# EasyEDA Pro project ProPrj_SensUs2026_ParisBioTek_PCBs.epro, schematic Schematic1_2
Board Name: Sensor board_2s_lp; Create Date: 2026-01-09; Page Name: P1; Project Name: PBT_PCB; Schematic Name: Schematic1_2; Update Date: 2026-08-30; Company: EasyEDA.com; Page Size: A4; Version: V1.0
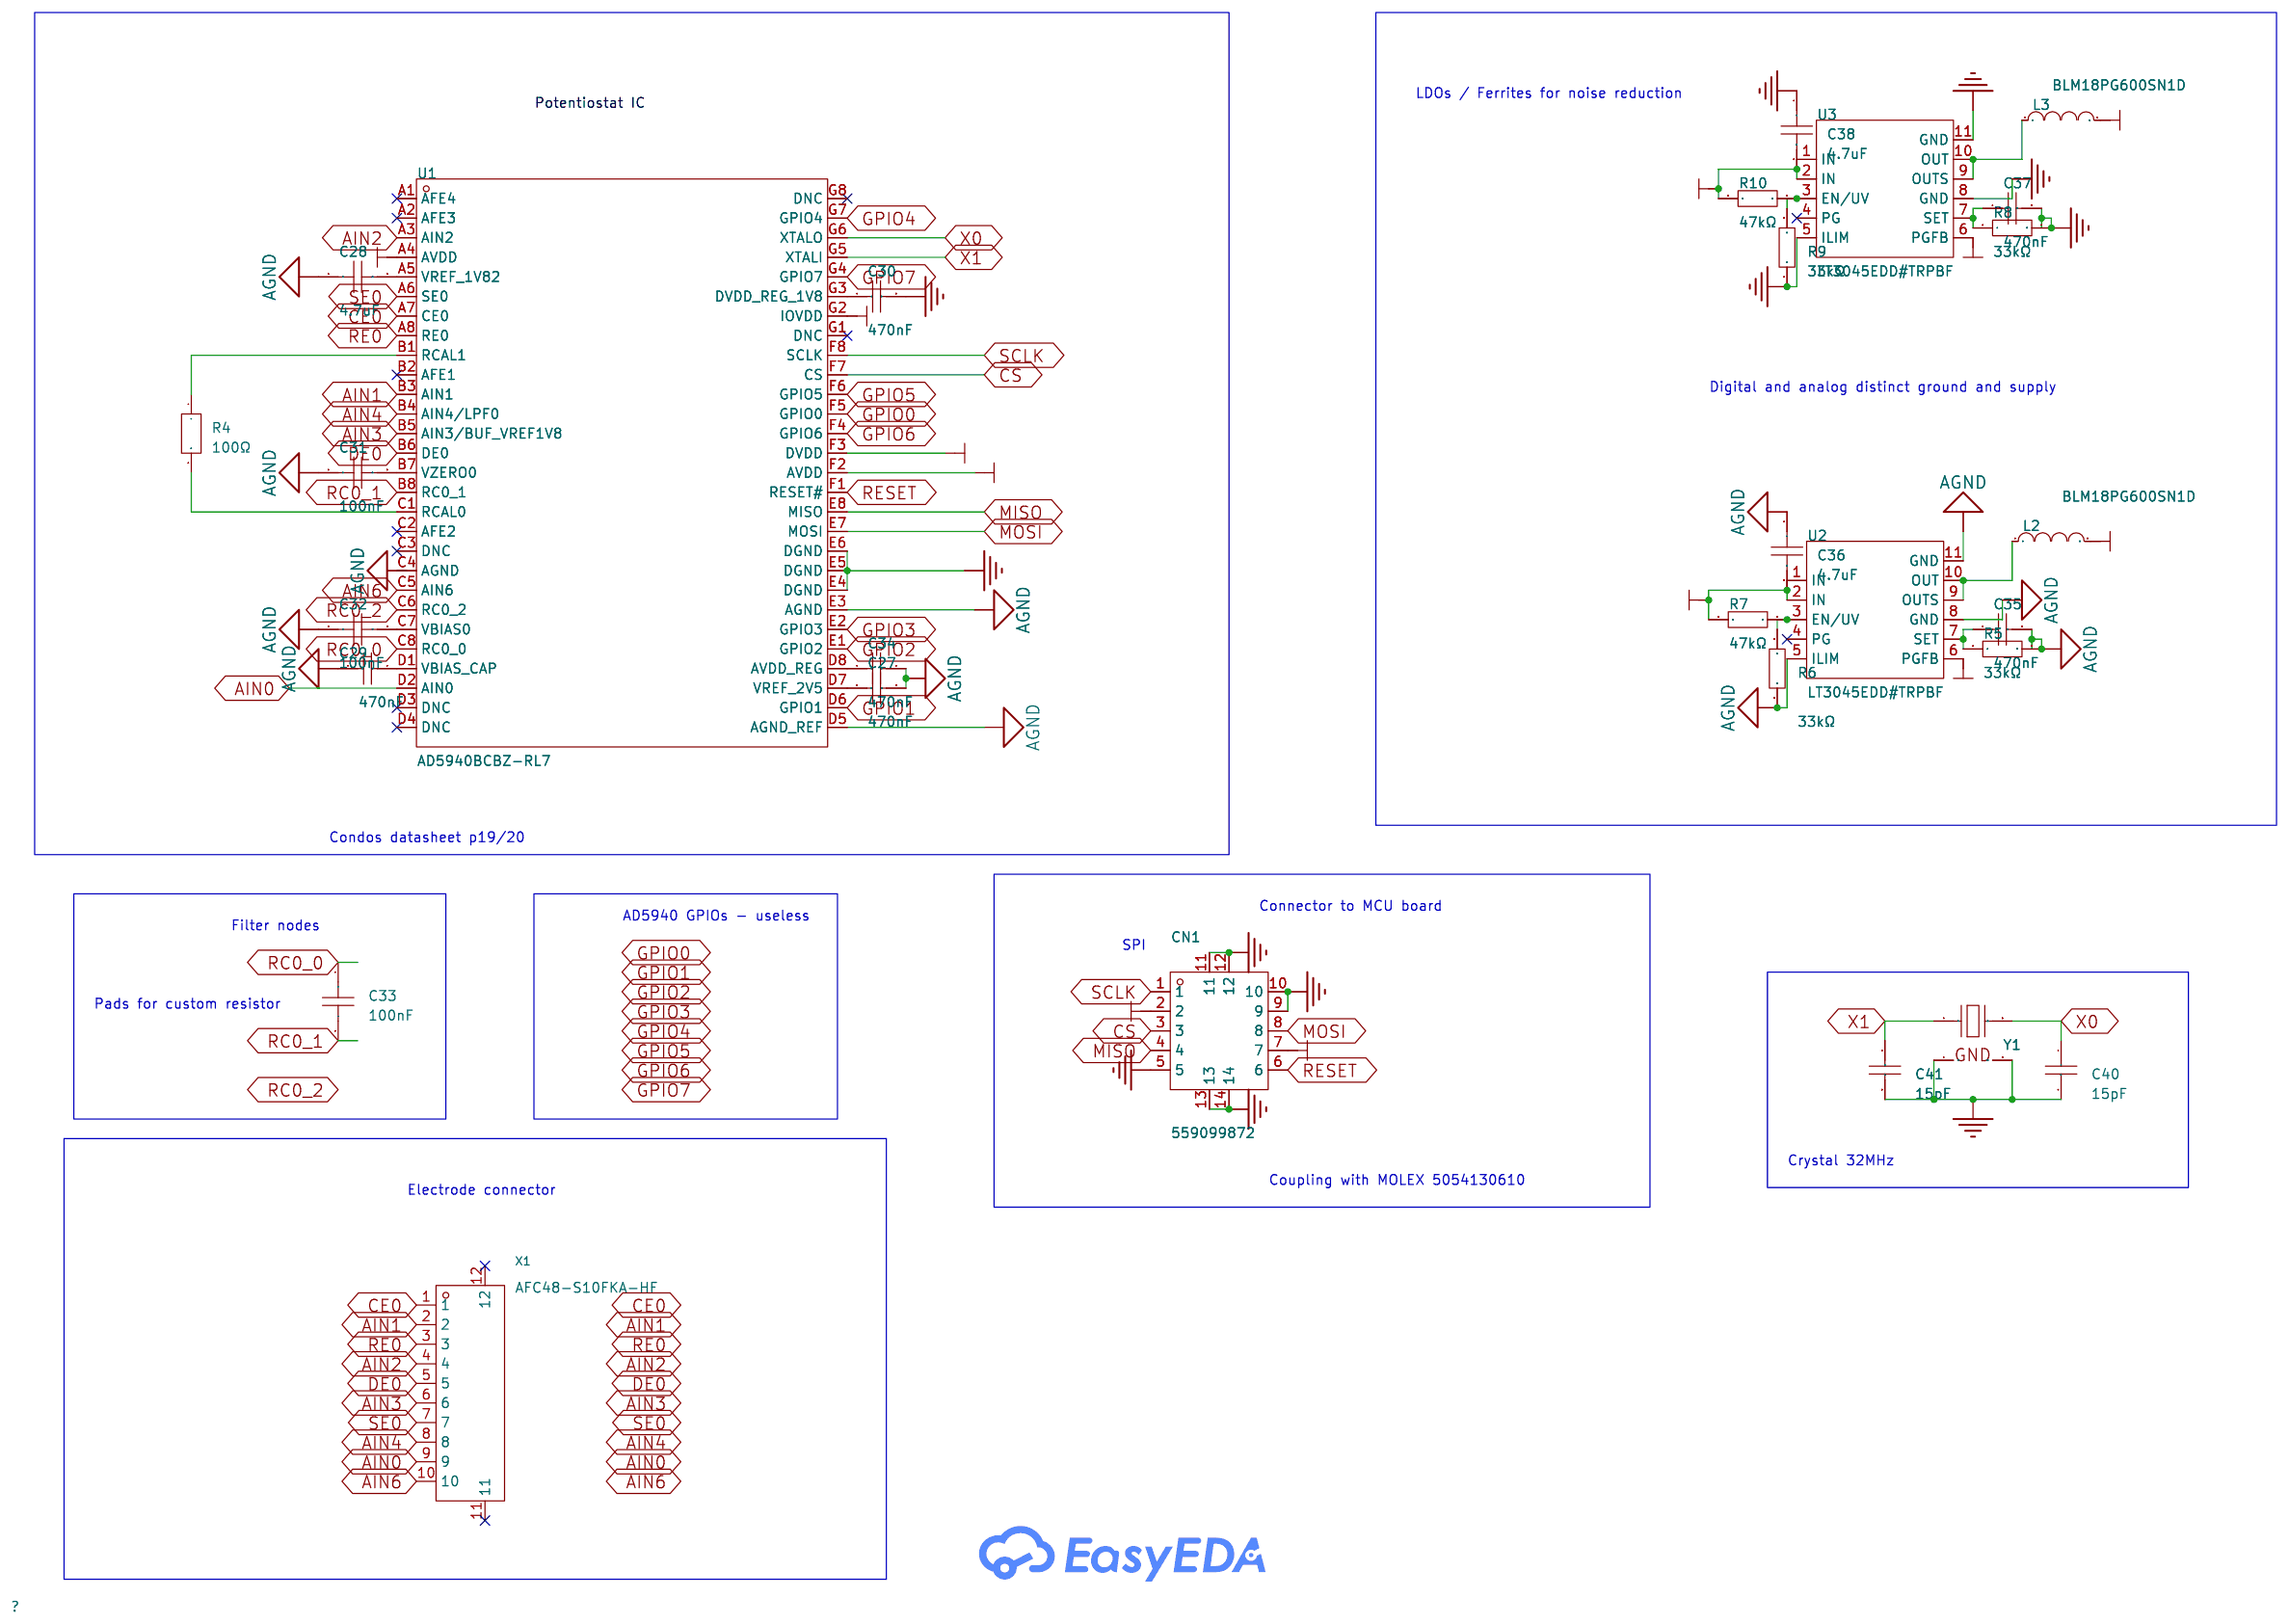
[diagram p0: schematic sheet]

## Parts
C27  470nF  [C0603]
C28  4.7uF  [C0402]
C29  470nF  [C0603]
C30  470nF  [C0603]
C31  100nF  [C0402]
C32  100nF  [C0402]
C33  100nF  [C0402]
C34  470nF  [C0603]
C35  470nF  [C0603]
C36  4.7uF  [C0402]
C37  470nF  [C0603]
C38  4.7uF  [C0402]
C40  15pF  [C0402]
C41  15pF  [C0402]
CN1  559099872  [CONN-SMD_559099872]
L2  BLM18PG600SN1D  [L0603]
L3  BLM18PG600SN1D  [L0603]
R4  100Ω  [R0603]
R5  33kΩ  [R0402]
R6  33kΩ  [R0402]
R7  47kΩ  [R0402]
R8  33kΩ  [R0402]
R9  33kΩ  [R0402]
R10  47kΩ  [R0402]
U1  AD5940BCBZ-RL7  [BGA-56_L4.2-W3.6-R8-C7-P0.40-TL]
U2  LT3045EDD#TRPBF  [DFN-10_L3.0-W3.0-P0.50-BL-EP]
U3  LT3045EDD#TRPBF  [DFN-10_L3.0-W3.0-P0.50-BL-EP]
X1  AFC48-S10FKA-HF  [FPC-SMD_AFC48-S10FKA-HF]
Y1  32MHz  [CRYSTAL-SMD_4P-L2.0-W1.6-BL]

## Library data of the parts
C27 C29 C30 C34 C35 C37 = CL10B474KA8NNNC: Capacitance:470nF Tolerance:±10% Tolerance:±10% Voltage Rating:25V Temperature Coefficient:X7R; LCSC Part Name: 470nF ±10% 25V; Supplier Part: C1623; Manufacturer: SAMSUNG(三星); Supplier Footprint: 0603; JLCPCB Part Class: Basic Part; Datasheet: https://item.szlcsc.com/datasheet/CL10B474KA8NNNC/1975.html; Supplier: LCSC; Tolerance: ±10%; Voltage Rating: 25V; Temperature Coefficient: X7R
C28 C36 C38 = CL05A475MP5NRNC: Capacitance:4.7uF Tolerance:±20% Tolerance:±20% Voltage Rating:10V Temperature Coefficient:X5R; LCSC Part Name: 4.7uF ±20% 10V; Supplier Part: C23733; Manufacturer: SAMSUNG(三星); Supplier Footprint: 0402; JLCPCB Part Class: Basic Part; Datasheet: https://item.szlcsc.com/datasheet/CL05A475MP5NRNC/24469.html; Supplier: LCSC; Tolerance: ±20%; Voltage Rating: 10V; Temperature Coefficient: X5R
C31-C33 = CL05B104KO5NNNC: Capacitance:100nF Tolerance:±10% Tolerance:±10% Voltage Rating:16V Temperature Coefficient:X7R; LCSC Part Name: 100nF ±10% 16V; Supplier Part: C1525; Manufacturer: SAMSUNG(三星); Supplier Footprint: 0402; JLCPCB Part Class: Basic Part; Datasheet: https://item.szlcsc.com/datasheet/CL05B104KO5NNNC/1877.html; Supplier: LCSC; Tolerance: ±10%; Voltage Rating: 16V; Temperature Coefficient: X7R
C40 C41 = 0402CG150J500NT: Capacitance:15pF Tolerance:±5% Tolerance:±5% Voltage Rating:50V Temperature Coefficient:C0G; LCSC Part Name: 15pF ±5% 50V; Supplier Part: C1548; Manufacturer: FH(风华); Supplier Footprint: 0402; Datasheet: https://item.szlcsc.com/datasheet/0402CG150J500NT/1900.html; Supplier: LCSC; Tolerance: ±5%; Voltage Rating: 50V; Temperature Coefficient: C0G
CN1 = 559099872: Number of Pins:10P Pitch:0.4mm Mounting Type:Surface Mount,Vertical Number of Rows:2 Current Rating:300mA Voltage Rating:50V System Fit Height:1.5mm Contact Material:Brass Contact Plating:Gold Operating Temperature:-40℃~+105℃ Operating Temperature:-40℃~+1; LCSC Part Name: PIN:10P 间距:0.4mm 立贴; Supplier Part: C724172; Manufacturer: MOLEX; Supplier Footprint: SMD,P=0.4mm; JLCPCB Part Class: Extended Part; Datasheet: https://www.molex.com/content/dam/molex/molex-dot-com/products/automated/en-us/salesdrawingpdf/559/55909/559099872_sd.pdf?inline\; Supplier: LCSC; Number of Pins: 10P; Pitch: 0.4mm; Mounting Type: Surface Mount,Vertical; Number of Rows: 2; Current Rating: 300mA; Voltage Rating: 50V; System Fit Height: 1.5mm; Contact Material: Brass; Contact Plating: Gold; Operating Temperature: -40℃~+105℃
L2 L3 = BLM18PG600SN1D: Impedance @ Frequency:60Ω@100MHz Tolerance:±25% Tolerance:±25% DC Resistance:100mΩ Current Rating:1A Circuits:1; LCSC Part Name: 单路 0603磁珠 阻抗60Ω@100MHz; Supplier Part: C85834; Manufacturer: muRata(村田); Supplier Footprint: 0603; JLCPCB Part Class: Extended Part; Datasheet: https://atta.szlcsc.com/upload/public/pdf/source/20180329/C160981_FD3C2D2622A377E203B89F4AA32B0741.pdf; Supplier: LCSC; Impedance @ Frequency: 60Ω@100MHz; Tolerance: ±25%; DC Resistance: 100mΩ; Current Rating: 1A; Circuits: 1
R4 = PTFR0603Q100RN9: Type:Thin Film Resistor Resistance: Tolerance:±0.02% Tolerance:±0.02% Power(Watts): Overload Voltage (Max): Temperature Coefficient:±10ppm/℃ Temperature Coefficient:±10ppm/℃ Operating Temperature Range:-55℃~+155℃ Operating Temperature Range:-55℃~+155℃; LCSC Part Name: 薄膜电阻 100Ω ±0.02% 100mW; Supplier Part: C23067430; Manufacturer: RESI(开步睿思); Supplier Footprint: 0603; JLCPCB Part Class: Extended Part; Datasheet: https://atta.szlcsc.com/upload/public/pdf/source/20240628/611D196B6AD2D0BC173B189B37FFA8DD.pdf; Supplier: LCSC; Type: Thin Film Resistor; Tolerance: ±0.02%; Temperature Coefficient: ±10ppm/℃; Operating Temperature Range: -55℃~+155℃
R5 R6 R8 R9 = 0402WGF3302TCE: Type:Thick Film Resistors Resistance:33kΩ Tolerance:±1% Tolerance:±1% Power(Watts): Overload Voltage (Max): Temperature Coefficient:±100ppm/℃ Temperature Coefficient:±100ppm/℃ Operating Temperature Range:-55℃~+155℃ Operating Temperature Range:-55℃~+155℃; LCSC Part Name: 33kΩ ±1% 62.5mW 厚膜电阻; Supplier Part: C25779; Manufacturer: UNI-ROYAL(厚声); Supplier Footprint: 0402; JLCPCB Part Class: Basic Part; Datasheet: https://atta.szlcsc.com/upload/public/pdf/source/20200306/C422600_1E6D84923E4A46A82E41ADD87F860B5C.pdf; Supplier: LCSC; Type: Thick Film Resistors; Tolerance: ±1%; Temperature Coefficient: ±100ppm/℃; Operating Temperature Range: -55℃~+155℃
R7 R10 = 0402WGF4702TCE: Type:Thick Film Resistor Resistance:47kΩ Tolerance:±1% Tolerance:±1% Power(Watts):62.5mW Voltage-Supply(Max):50V Temperature Coefficient:±100ppm/℃ Temperature Coefficient:±100ppm/℃ Operating Temperature:-55℃~+155℃ Operating Temperature:-55℃~+155℃; LCSC Part Name: 47kΩ ±1% 62.5mW 厚膜电阻; Supplier Part: C25792; Manufacturer: UNI-ROYAL(厚声); Supplier Footprint: 0402; JLCPCB Part Class: Basic Part; Datasheet: https://item.szlcsc.com/datasheet/0402WGF4702TCE/26535.html; Supplier: LCSC; Type: Thick Film Resistor; Tolerance: ±1%; Power(Watts): 62.5mW; Voltage-Supply(Max): 50V; Temperature Coefficient: ±100ppm/℃; Operating Temperature: -55℃~+155℃
U1 = AD5940BCBZ-RL7: Supply Voltage:2.8V~3.6V Supply Voltage:2.8V~3.6V; LCSC Part Name: 高精度、低功耗模拟前端(AFE); Supplier Part: C650308; Manufacturer: ADI(亚德诺); Supplier Footprint: WLCSP-56(3.6x4.2); JLCPCB Part Class: Extended Part; Datasheet: https://atta.szlcsc.com/upload/public/pdf/source/20200728/C650309_7D1BE8C70E2D0D9989DAD7B9D3F56AA7.pdf; Supplier: LCSC; Supply Voltage: 2.8V~3.6V
U2 U3 = LT3045EDD#TRPBF_C514420: Output Type:Adjustable Voltage - Supply:20V Output Voltage:0V~15V Output Voltage:0V~15V Output Current:500mA Power Supply Rejection Ratio (PSRR):76dB@(1MHz) Voltage Dropout:350mV@(500mA) standby current:2.2mA Noise:0.8uVrms Features:Enable；Over Current Pr; LCSC Part Name: 20V、500mA、超低噪声、超高PSRR线性稳压器; Supplier Part: C514420; Manufacturer: ADI(亚德诺); Supplier Footprint: DFN-10-EP(3x3); JLCPCB Part Class: Extended Part; Datasheet: https://item.szlcsc.com/datasheet/LT3045EDD%2523TRPBF/529461.html; Supplier: LCSC; Output Type: Adjustable; Voltage - Supply: 20V; Output Voltage: 0V~15V; Output Current: 500mA; Power Supply Rejection Ratio (PSRR): 76dB@(1MHz); Voltage Dropout: 350mV@(500mA); standby current: 2.2mA; Noise: 0.8uVrms; Features: Enable；Over Current Protection；PG Pin；Over Temperature Protection; Operating Temperature: -40℃~+125℃@(Tj); Output Configuration: Positive; Number of Outputs: 1
X1 = AFC48-S10FKA-HF: Locking Feature:Clamshell Contact Type:Bottom Contact Number of Contacts:10P Pitch:0.5mm Mounting Type:卧贴 FFC, FCB Thickness:0.3mm FFC, FCB Thickness:0.3mm Height Above Board:0.95mm Operating Temperature Range:- Operating Temperature Range:-; LCSC Part Name: 间距:0.5mm P数:10P 翻盖式 下接; Supplier Part: C2842519; Manufacturer: JS(钜硕电子); Supplier Footprint: SMD,P=0.5mm,卧贴; JLCPCB Part Class: Extended Part; Datasheet: https://atta.szlcsc.com/upload/public/pdf/source/20210628/C2842515_9272D4E932D88818B72FB4BFB2F396D6.pdf; Supplier: LCSC; Locking Feature: Clamshell; Contact Type: Bottom Contact; Number of Contacts: 10P; Pitch: 0.5mm; Mounting Type: 卧贴; FFC, FCB Thickness: 0.3mm; Height Above Board: 0.95mm
Y1 = XL7EL89CKI-111YLC-32M: Crystal Type:Surface Mount Crystal Frequency: Normal temperature Frequency Tolerance:±10ppm Normal temperature Frequency Tolerance:±10ppm External load capacitor: Frequency Stability(Full temperature range):±20ppm Frequency Stability(Full temperature rang; LCSC Part Name: 32MHz ±10ppm 8pF; Supplier Part: C2965582; Manufacturer: YXC(扬兴晶振); Supplier Footprint: SMD2016-4P; JLCPCB Part Class: Extended Part; Datasheet: https://atta.szlcsc.com/upload/public/pdf/source/20240329/C26C9A15A73CBCFBF373B30A8E126750.pdf; Supplier: LCSC; Crystal Type: Surface Mount Crystal; Normal temperature Frequency Tolerance: ±10ppm; Frequency Stability(Full temperature range): ±20ppm

## Nets
+3.3VA: C36.2 CN1.2 R7.2 U2.1(IN) U2.2(IN) U2.6(PGFB)
+3.3VD: C38.2 CN1.7 R10.2 U3.1(IN) U3.2(IN) U3.6(PGFB)
AGND: C27.2 C28.1 C29.1 C31.1 C32.1 C34.2 C35.2 C36.1 R5.2 R6.1 U1.C4(AGND) U1.D5(AGND_REF) U1.E3(AGND) U2.5(ILIM) U2.8(GND) U2.11(GND)
AVDD: L2.2 U1.A4(AVDD) U1.F2(AVDD)
DGND: C30.2 C37.2 C38.1 C40.2 C41.2 CN1.5 CN1.9 CN1.10 CN1.11 CN1.12 CN1.13 CN1.14 R8.2 R9.1 U1.E4(DGND) U1.E5(DGND) U1.E6(DGND) U3.5(ILIM) U3.8(GND) U3.11(GND) Y1.2(GND) Y1.4(GND)
DVDD: L3.2 U1.F3(DVDD) U1.G2(IOVDD)
AIN0: U1.D2(AIN0) X1.9
AIN1: U1.B3(AIN1) X1.2
AIN2: U1.A3(AIN2) X1.4
AIN3: U1.B5(AIN3/BUF_VREF1V8) X1.6
AIN4: U1.B4(AIN4/LPF0) X1.8
AIN6: U1.C5(AIN6) X1.10
CE0: U1.A7(CE0) X1.1
CS: CN1.3 U1.F7(CS)
DE0: U1.B6(DE0) X1.5
GPIO0: U1.F5(GPIO0)
GPIO1: U1.D6(GPIO1)
GPIO2: U1.E1(GPIO2)
GPIO3: U1.E2(GPIO3)
GPIO4: U1.G7(GPIO4)
GPIO5: U1.F6(GPIO5)
GPIO6: U1.F4(GPIO6)
GPIO7: U1.G4(GPIO7)
MISO: CN1.4 U1.E8(MISO)
MOSI: CN1.8 U1.E7(MOSI)
RC0_0: C33.1 U1.C8(RC0_0)
RC0_1: C33.2 U1.B8(RC0_1)
RC0_2: U1.C6(RC0_2)
RE0: U1.A8(RE0) X1.3
RESET: CN1.6 U1.F1(RESET#)
SCLK: CN1.1 U1.F8(SCLK)
SE0: U1.A6(SE0) X1.7
X0: C40.1 U1.G6(XTALO) Y1.3
X1: C41.1 U1.G5(XTALI) Y1.1
$1N2048: C27.1 U1.D7(VREF_2V5)
$1N2152: C28.2 U1.A5(VREF_1V82)
$1N2188: C29.2 U1.D1(VBIAS_CAP)
$1N2486: C30.1 U1.G3(DVDD_REG_1V8)
$1N2550: C31.2 U1.B7(VZERO0)
$1N3554: C32.2 U1.C7(VBIAS0)
$1N3572: R4.1 U1.B1(RCAL1)
$1N3580: R4.2 U1.C1(RCAL0)
$1N4271: C34.1 U1.D8(AVDD_REG)
$1N7940: L2.1 U2.9(OUTS) U2.10(OUT)
$1N7995: C35.1 R5.1 U2.7(SET)
$1N8461: R6.2 R7.1 U2.3(EN/UV)
$1N8870: L3.1 U3.9(OUTS) U3.10(OUT)
$1N8877: C37.1 R8.1 U3.7(SET)
$1N8893: R9.2 R10.1 U3.3(EN/UV)

Not connected (* = marked no-connect by the designer): U1 A1(AFE4)* A2(AFE3)* B2(AFE1)* C2(AFE2)* C3(DNC)* D3(DNC)* D4(DNC)* G1(DNC)* G8(DNC)*; U2 4(PG)*; U3 4(PG)*; X1 11* 12*

## Notes on the sheet
- Potentiostat IC
- LDOs / Ferrites for noise reduction
- Digital and analog distinct ground and supply
- Condos datasheet p19/20
- AD5940 GPIOs - useless
- Connector to MCU board
- Filter nodes
- SPI
- Pads for custom resistor
- Crystal 32MHz
- Electrode connector
- Coupling with MOLEX 5054130610
